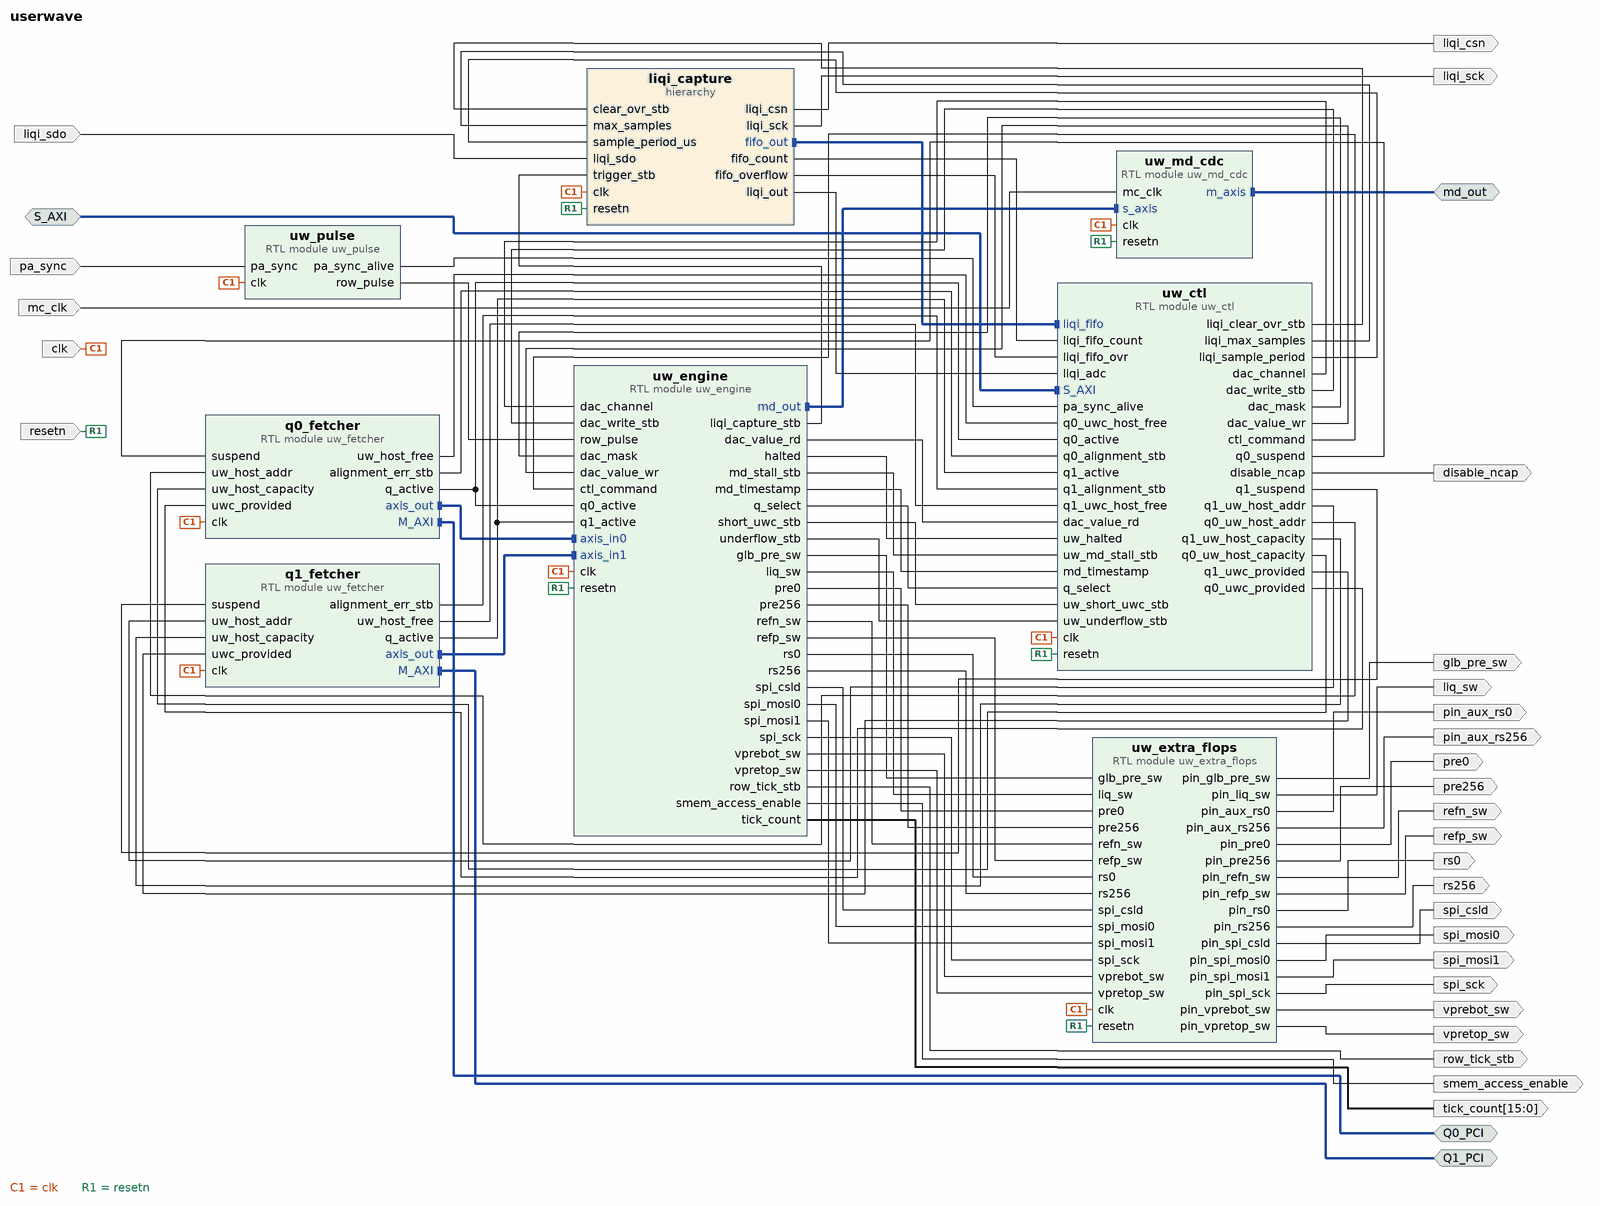
[diagram p0: block diagram of the top level]
# Vivado block design userwave, xcku15p-ffve1517-3-e, Vivado 2024.2
create_bd_design userwave

create_bd_intf_port -mode Master -vlnv xilinx.com:interface:aximm_rtl:1.0 Q0_PCI
set_property -dict [list \
  CONFIG.ADDR_WIDTH 64 \
  CONFIG.CLK_DOMAIN top_level_xdma_0_0_axi_aclk \
  CONFIG.DATA_WIDTH 512 \
  CONFIG.FREQ_HZ 250000000 \
  CONFIG.HAS_REGION 0 \
  CONFIG.NUM_READ_OUTSTANDING 2 \
  CONFIG.NUM_WRITE_OUTSTANDING 2 \
  CONFIG.PROTOCOL AXI4 \
] [get_bd_intf_ports Q0_PCI]
create_bd_intf_port -mode Master -vlnv xilinx.com:interface:aximm_rtl:1.0 Q1_PCI
set_property -dict [list \
  CONFIG.ADDR_WIDTH 64 \
  CONFIG.CLK_DOMAIN top_level_xdma_0_0_axi_aclk \
  CONFIG.DATA_WIDTH 512 \
  CONFIG.FREQ_HZ 250000000 \
  CONFIG.HAS_REGION 0 \
  CONFIG.NUM_READ_OUTSTANDING 2 \
  CONFIG.NUM_WRITE_OUTSTANDING 2 \
  CONFIG.PROTOCOL AXI4 \
] [get_bd_intf_ports Q1_PCI]
create_bd_intf_port -mode Slave -vlnv xilinx.com:interface:aximm_rtl:1.0 S_AXI
set_property -dict [list \
  CONFIG.ADDR_WIDTH 16 \
  CONFIG.ARUSER_WIDTH 0 \
  CONFIG.AWUSER_WIDTH 0 \
  CONFIG.BUSER_WIDTH 0 \
  CONFIG.CLK_DOMAIN top_level_xdma_0_0_axi_aclk \
  CONFIG.DATA_WIDTH 32 \
  CONFIG.FREQ_HZ 250000000 \
  CONFIG.HAS_BRESP 1 \
  CONFIG.HAS_BURST 0 \
  CONFIG.HAS_CACHE 0 \
  CONFIG.HAS_LOCK 0 \
  CONFIG.HAS_PROT 1 \
  CONFIG.HAS_QOS 0 \
  CONFIG.HAS_REGION 0 \
  CONFIG.HAS_RRESP 1 \
  CONFIG.HAS_WSTRB 1 \
  CONFIG.ID_WIDTH 0 \
  CONFIG.MAX_BURST_LENGTH 1 \
  CONFIG.NUM_READ_OUTSTANDING 1 \
  CONFIG.NUM_READ_THREADS 1 \
  CONFIG.NUM_WRITE_OUTSTANDING 1 \
  CONFIG.NUM_WRITE_THREADS 1 \
  CONFIG.PROTOCOL AXI4LITE \
  CONFIG.READ_WRITE_MODE READ_WRITE \
  CONFIG.RUSER_BITS_PER_BYTE 0 \
  CONFIG.RUSER_WIDTH 0 \
  CONFIG.SUPPORTS_NARROW_BURST 0 \
  CONFIG.WUSER_BITS_PER_BYTE 0 \
  CONFIG.WUSER_WIDTH 0 \
] [get_bd_intf_ports S_AXI]
create_bd_intf_port -mode Master -vlnv xilinx.com:interface:axis_rtl:1.0 md_out
set_property -dict {CONFIG.FREQ_HZ 250000000} [get_bd_intf_ports md_out]
create_bd_port -dir I -type clk clk
set_property -dict [list \
  CONFIG.ASSOCIATED_BUSIF S_AXI:Q1_PCI:Q0_PCI \
  CONFIG.CLK_DOMAIN top_level_xdma_0_0_axi_aclk \
  CONFIG.FREQ_HZ 250000000 \
] [get_bd_ports clk]
create_bd_port -dir O glb_pre_sw
create_bd_port -dir O liq_sw
create_bd_port -dir I pa_sync
create_bd_port -dir O pre0
create_bd_port -dir O pre256
create_bd_port -dir O refn_sw
create_bd_port -dir O refp_sw
create_bd_port -dir I -type rst resetn
create_bd_port -dir O row_tick_stb
create_bd_port -dir O rs0
create_bd_port -dir O rs256
create_bd_port -dir O smem_access_enable
create_bd_port -dir O spi_csld
create_bd_port -dir O spi_mosi0
create_bd_port -dir O spi_mosi1
create_bd_port -dir O spi_sck
create_bd_port -dir O -from 15 -to 0 tick_count
create_bd_port -dir O vprebot_sw
create_bd_port -dir O vpretop_sw
create_bd_port -dir O disable_ncap
create_bd_port -dir I -type clk mc_clk
set_property -dict {CONFIG.FREQ_HZ 250000000} [get_bd_ports mc_clk]
create_bd_port -dir O pin_aux_rs0
create_bd_port -dir O pin_aux_rs256
create_bd_port -dir O liqi_sck
create_bd_port -dir O liqi_csn
create_bd_port -dir I liqi_sdo

create_bd_cell -type module -reference uw_fetcher q0_fetcher
create_bd_cell -type module -reference uw_fetcher q1_fetcher
create_bd_cell -type module -reference uw_ctl uw_ctl
create_bd_cell -type module -reference uw_engine uw_engine
create_bd_cell -type module -reference uw_extra_flops uw_extra_flops
create_bd_cell -type module -reference uw_pulse uw_pulse
set_property -dict {CONFIG.PERIOD 256} [get_bd_cells uw_pulse]
create_bd_cell -type module -reference uw_md_cdc uw_md_cdc
create_bd_cell -type hier liqi_capture

# ---- hierarchy /liqi_capture ----
current_bd_instance /liqi_capture
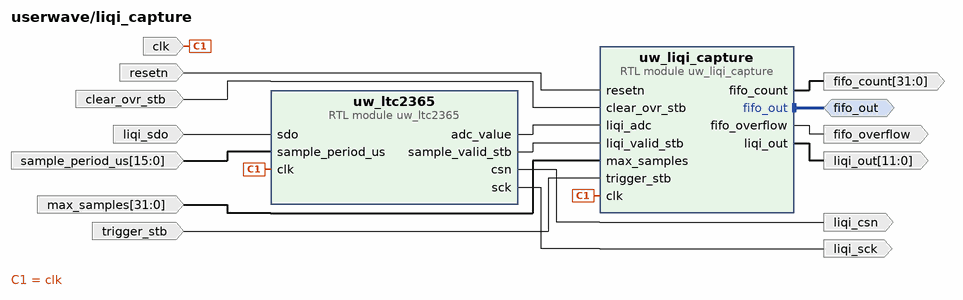
[diagram p1: block diagram inside /liqi_capture]
create_bd_intf_pin -mode Master -vlnv xilinx.com:interface:axis_rtl:1.0 fifo_out
create_bd_pin -dir I -type clk clk
create_bd_pin -dir I -type rst resetn
create_bd_pin -dir I trigger_stb
create_bd_pin -dir I -from 31 -to 0 max_samples
create_bd_pin -dir O -from 31 -to 0 fifo_count
create_bd_pin -dir O fifo_overflow
create_bd_pin -dir I clear_ovr_stb
create_bd_pin -dir O -from 11 -to 0 liqi_out
create_bd_pin -dir O liqi_sck
create_bd_pin -dir O liqi_csn
create_bd_pin -dir I liqi_sdo
create_bd_pin -dir I -from 15 -to 0 sample_period_us

create_bd_cell -type module -reference uw_liqi_capture uw_liqi_capture
create_bd_cell -type module -reference uw_ltc2365 uw_ltc2365

# ---- connections ----

current_bd_instance /liqi_capture
connect_bd_intf_net [get_bd_intf_pins fifo_out] [get_bd_intf_pins uw_liqi_capture/fifo_out]
connect_bd_net [get_bd_pins clk] [get_bd_pins uw_liqi_capture/clk] [get_bd_pins uw_ltc2365/clk]
connect_bd_net [get_bd_pins liqi_sdo] [get_bd_pins uw_ltc2365/sdo]
connect_bd_net [get_bd_pins resetn] [get_bd_pins uw_liqi_capture/resetn]
connect_bd_net -net uw_ctl_liqi_clear_ovr_stb [get_bd_pins clear_ovr_stb] [get_bd_pins uw_liqi_capture/clear_ovr_stb]
connect_bd_net -net uw_ctl_liqi_max_samples [get_bd_pins max_samples] [get_bd_pins uw_liqi_capture/max_samples]
connect_bd_net -net uw_ctl_liqi_sample_period [get_bd_pins sample_period_us] [get_bd_pins uw_ltc2365/sample_period_us]
connect_bd_net -net uw_engine_liqi_capture_stb [get_bd_pins trigger_stb] [get_bd_pins uw_liqi_capture/trigger_stb]
connect_bd_net [get_bd_pins uw_liqi_capture/fifo_count] [get_bd_pins fifo_count]
connect_bd_net [get_bd_pins uw_liqi_capture/fifo_overflow] [get_bd_pins fifo_overflow]
connect_bd_net [get_bd_pins uw_liqi_capture/liqi_out] [get_bd_pins liqi_out]
connect_bd_net [get_bd_pins uw_ltc2365/adc_value] [get_bd_pins uw_liqi_capture/liqi_adc]
connect_bd_net [get_bd_pins uw_ltc2365/csn] [get_bd_pins liqi_csn]
connect_bd_net [get_bd_pins uw_ltc2365/sample_valid_stb] [get_bd_pins uw_liqi_capture/liqi_valid_stb]
connect_bd_net [get_bd_pins uw_ltc2365/sck] [get_bd_pins liqi_sck]

current_bd_instance /
connect_bd_intf_net [get_bd_intf_ports S_AXI] [get_bd_intf_pins uw_ctl/S_AXI]
connect_bd_intf_net [get_bd_intf_pins uw_engine/md_out] [get_bd_intf_pins uw_md_cdc/s_axis]
connect_bd_intf_net -intf_net uw_fetcher_0_M_AXI [get_bd_intf_ports Q0_PCI] [get_bd_intf_pins q0_fetcher/M_AXI]
connect_bd_intf_net -intf_net uw_fetcher_1_M_AXI [get_bd_intf_ports Q1_PCI] [get_bd_intf_pins q1_fetcher/M_AXI]
connect_bd_intf_net -intf_net uw_fetcher_1_axis_out [get_bd_intf_pins q1_fetcher/axis_out] [get_bd_intf_pins uw_engine/axis_in1]
connect_bd_intf_net -intf_net uw_fetcher_axis_out [get_bd_intf_pins uw_engine/axis_in0] [get_bd_intf_pins q0_fetcher/axis_out]
connect_bd_intf_net -intf_net uw_liqi_capture_fifo_out [get_bd_intf_pins liqi_capture/fifo_out] [get_bd_intf_pins uw_ctl/liqi_fifo]
connect_bd_intf_net [get_bd_intf_pins uw_md_cdc/m_axis] [get_bd_intf_ports md_out]
connect_bd_net [get_bd_ports clk] \
  [get_bd_pins liqi_capture/clk] [get_bd_pins uw_ctl/clk] [get_bd_pins uw_extra_flops/clk] [get_bd_pins uw_pulse/clk] \
  [get_bd_pins q0_fetcher/clk] [get_bd_pins q1_fetcher/clk] [get_bd_pins uw_engine/clk] [get_bd_pins uw_md_cdc/clk]
connect_bd_net -net dac_channel_1 [get_bd_pins uw_ctl/dac_channel] [get_bd_pins uw_engine/dac_channel]
connect_bd_net -net dac_manual_start_stb_1 [get_bd_pins uw_ctl/dac_write_stb] [get_bd_pins uw_engine/dac_write_stb]
connect_bd_net -net dac_mask_1 [get_bd_pins uw_ctl/dac_mask] [get_bd_pins uw_engine/dac_mask]
connect_bd_net -net dac_value_wr_1 [get_bd_pins uw_ctl/dac_value_wr] [get_bd_pins uw_engine/dac_value_wr]
connect_bd_net [get_bd_ports liqi_sdo] [get_bd_pins liqi_capture/liqi_sdo]
connect_bd_net [get_bd_ports mc_clk] [get_bd_pins uw_md_cdc/mc_clk]
connect_bd_net [get_bd_ports pa_sync] [get_bd_pins uw_pulse/pa_sync]
connect_bd_net [get_bd_ports resetn] \
  [get_bd_pins liqi_capture/resetn] [get_bd_pins uw_ctl/resetn] [get_bd_pins uw_extra_flops/resetn] \
  [get_bd_pins uw_engine/resetn] [get_bd_pins uw_md_cdc/resetn]
connect_bd_net [get_bd_pins uw_ctl/ctl_command] [get_bd_pins uw_engine/ctl_command]
connect_bd_net [get_bd_pins uw_ctl/disable_ncap] [get_bd_ports disable_ncap]
connect_bd_net [get_bd_pins uw_ctl/liqi_clear_ovr_stb] [get_bd_pins liqi_capture/clear_ovr_stb]
connect_bd_net [get_bd_pins uw_ctl/liqi_max_samples] [get_bd_pins liqi_capture/max_samples]
connect_bd_net [get_bd_pins uw_ctl/liqi_sample_period] [get_bd_pins liqi_capture/sample_period_us]
connect_bd_net [get_bd_pins uw_ctl/q0_suspend] [get_bd_pins q0_fetcher/suspend]
connect_bd_net [get_bd_pins uw_ctl/q1_suspend] [get_bd_pins q1_fetcher/suspend]
connect_bd_net [get_bd_pins uw_ctl/q1_uw_host_addr] [get_bd_pins q1_fetcher/uw_host_addr]
connect_bd_net [get_bd_pins uw_ctl/q1_uw_host_capacity] [get_bd_pins q1_fetcher/uw_host_capacity]
connect_bd_net [get_bd_pins uw_ctl/q1_uwc_provided] [get_bd_pins q1_fetcher/uwc_provided]
connect_bd_net -net uw_ctl_uw_host_addr [get_bd_pins uw_ctl/q0_uw_host_addr] [get_bd_pins q0_fetcher/uw_host_addr]
connect_bd_net -net uw_ctl_uw_host_capacity [get_bd_pins uw_ctl/q0_uw_host_capacity] [get_bd_pins q0_fetcher/uw_host_capacity]
connect_bd_net -net uw_ctl_uwc_provided [get_bd_pins uw_ctl/q0_uwc_provided] [get_bd_pins q0_fetcher/uwc_provided]
connect_bd_net [get_bd_pins uw_engine/dac_value_rd] [get_bd_pins uw_ctl/dac_value_rd]
connect_bd_net [get_bd_pins uw_engine/glb_pre_sw] [get_bd_pins uw_extra_flops/glb_pre_sw]
connect_bd_net [get_bd_pins uw_engine/halted] [get_bd_pins uw_ctl/uw_halted]
connect_bd_net [get_bd_pins uw_engine/liq_sw] [get_bd_pins uw_extra_flops/liq_sw]
connect_bd_net [get_bd_pins uw_engine/liqi_capture_stb] [get_bd_pins liqi_capture/trigger_stb]
connect_bd_net [get_bd_pins uw_engine/md_stall_stb] [get_bd_pins uw_ctl/uw_md_stall_stb]
connect_bd_net [get_bd_pins uw_engine/md_timestamp] [get_bd_pins uw_ctl/md_timestamp]
connect_bd_net [get_bd_pins uw_engine/pre0] [get_bd_pins uw_extra_flops/pre0]
connect_bd_net [get_bd_pins uw_engine/pre256] [get_bd_pins uw_extra_flops/pre256]
connect_bd_net [get_bd_pins uw_engine/q_select] [get_bd_pins uw_ctl/q_select]
connect_bd_net [get_bd_pins uw_engine/refn_sw] [get_bd_pins uw_extra_flops/refn_sw]
connect_bd_net [get_bd_pins uw_engine/refp_sw] [get_bd_pins uw_extra_flops/refp_sw]
connect_bd_net [get_bd_pins uw_engine/row_tick_stb] [get_bd_ports row_tick_stb]
connect_bd_net [get_bd_pins uw_engine/rs0] [get_bd_pins uw_extra_flops/rs0]
connect_bd_net [get_bd_pins uw_engine/rs256] [get_bd_pins uw_extra_flops/rs256]
connect_bd_net [get_bd_pins uw_engine/short_uwc_stb] [get_bd_pins uw_ctl/uw_short_uwc_stb]
connect_bd_net [get_bd_pins uw_engine/smem_access_enable] [get_bd_ports smem_access_enable]
connect_bd_net [get_bd_pins uw_engine/spi_csld] [get_bd_pins uw_extra_flops/spi_csld]
connect_bd_net [get_bd_pins uw_engine/spi_mosi0] [get_bd_pins uw_extra_flops/spi_mosi0]
connect_bd_net [get_bd_pins uw_engine/spi_mosi1] [get_bd_pins uw_extra_flops/spi_mosi1]
connect_bd_net [get_bd_pins uw_engine/spi_sck] [get_bd_pins uw_extra_flops/spi_sck]
connect_bd_net [get_bd_pins uw_engine/tick_count] [get_bd_ports tick_count]
connect_bd_net [get_bd_pins uw_engine/underflow_stb] [get_bd_pins uw_ctl/uw_underflow_stb]
connect_bd_net [get_bd_pins uw_engine/vprebot_sw] [get_bd_pins uw_extra_flops/vprebot_sw]
connect_bd_net [get_bd_pins uw_engine/vpretop_sw] [get_bd_pins uw_extra_flops/vpretop_sw]
connect_bd_net -net uw_extra_flops_0_pin_glb_pre_sw [get_bd_pins uw_extra_flops/pin_glb_pre_sw] [get_bd_ports glb_pre_sw]
connect_bd_net -net uw_extra_flops_0_pin_liq_sw [get_bd_pins uw_extra_flops/pin_liq_sw] [get_bd_ports liq_sw]
connect_bd_net -net uw_extra_flops_0_pin_pre0 [get_bd_pins uw_extra_flops/pin_pre0] [get_bd_ports pre0]
connect_bd_net -net uw_extra_flops_0_pin_pre256 [get_bd_pins uw_extra_flops/pin_pre256] [get_bd_ports pre256]
connect_bd_net -net uw_extra_flops_0_pin_refn_sw [get_bd_pins uw_extra_flops/pin_refn_sw] [get_bd_ports refn_sw]
connect_bd_net -net uw_extra_flops_0_pin_refp_sw [get_bd_pins uw_extra_flops/pin_refp_sw] [get_bd_ports refp_sw]
connect_bd_net -net uw_extra_flops_0_pin_rs0 [get_bd_pins uw_extra_flops/pin_rs0] [get_bd_ports rs0]
connect_bd_net -net uw_extra_flops_0_pin_rs256 [get_bd_pins uw_extra_flops/pin_rs256] [get_bd_ports rs256]
connect_bd_net -net uw_extra_flops_0_pin_spi_csld [get_bd_pins uw_extra_flops/pin_spi_csld] [get_bd_ports spi_csld]
connect_bd_net -net uw_extra_flops_0_pin_spi_mosi0 [get_bd_pins uw_extra_flops/pin_spi_mosi0] [get_bd_ports spi_mosi0]
connect_bd_net -net uw_extra_flops_0_pin_spi_mosi1 [get_bd_pins uw_extra_flops/pin_spi_mosi1] [get_bd_ports spi_mosi1]
connect_bd_net -net uw_extra_flops_0_pin_spi_sck [get_bd_pins uw_extra_flops/pin_spi_sck] [get_bd_ports spi_sck]
connect_bd_net -net uw_extra_flops_0_pin_vprebot_sw [get_bd_pins uw_extra_flops/pin_vprebot_sw] [get_bd_ports vprebot_sw]
connect_bd_net -net uw_extra_flops_0_pin_vpretop_sw [get_bd_pins uw_extra_flops/pin_vpretop_sw] [get_bd_ports vpretop_sw]
connect_bd_net [get_bd_pins uw_extra_flops/pin_aux_rs0] [get_bd_ports pin_aux_rs0]
connect_bd_net [get_bd_pins uw_extra_flops/pin_aux_rs256] [get_bd_ports pin_aux_rs256]
connect_bd_net -net uw_fetcher_0_q_active [get_bd_pins q0_fetcher/q_active] [get_bd_pins uw_ctl/q0_active] [get_bd_pins uw_engine/q0_active]
connect_bd_net -net uw_fetcher_0_uw_host_free [get_bd_pins q0_fetcher/uw_host_free] [get_bd_pins uw_ctl/q0_uwc_host_free]
connect_bd_net -net uw_fetcher_1_alignment_err_stb [get_bd_pins q1_fetcher/alignment_err_stb] [get_bd_pins uw_ctl/q1_alignment_stb]
connect_bd_net -net uw_fetcher_1_q_active [get_bd_pins q1_fetcher/q_active] [get_bd_pins uw_ctl/q1_active] [get_bd_pins uw_engine/q1_active]
connect_bd_net -net uw_fetcher_1_uw_host_free [get_bd_pins q1_fetcher/uw_host_free] [get_bd_pins uw_ctl/q1_uwc_host_free]
connect_bd_net -net uw_fetcher_alignment_err_stb [get_bd_pins q0_fetcher/alignment_err_stb] [get_bd_pins uw_ctl/q0_alignment_stb]
connect_bd_net -net uw_liqi_capture_fifo_count [get_bd_pins liqi_capture/fifo_count] [get_bd_pins uw_ctl/liqi_fifo_count]
connect_bd_net -net uw_liqi_capture_fifo_overflow [get_bd_pins liqi_capture/fifo_overflow] [get_bd_pins uw_ctl/liqi_fifo_ovr]
connect_bd_net -net uw_liqi_capture_liqi_out [get_bd_pins liqi_capture/liqi_out] [get_bd_pins uw_ctl/liqi_adc]
connect_bd_net -net uw_ltc2365_csn [get_bd_pins liqi_capture/liqi_csn] [get_bd_ports liqi_csn]
connect_bd_net -net uw_ltc2365_sck [get_bd_pins liqi_capture/liqi_sck] [get_bd_ports liqi_sck]
connect_bd_net -net uw_pulse_pa_pulse [get_bd_pins uw_pulse/row_pulse] [get_bd_pins uw_engine/row_pulse]
connect_bd_net [get_bd_pins uw_pulse/pa_sync_alive] [get_bd_pins uw_ctl/pa_sync_alive]

# ---- address map ----
assign_bd_address -offset 0x0000000000000000 -range 16E -target_address_space [get_bd_addr_spaces q0_fetcher/M_AXI] [get_bd_addr_segs Q0_PCI/Reg]
assign_bd_address -offset 0x0000000000000000 -range 16E -target_address_space [get_bd_addr_spaces q1_fetcher/M_AXI] [get_bd_addr_segs Q1_PCI/Reg]
assign_bd_address -offset 0x1000 -range 4K -target_address_space [get_bd_addr_spaces S_AXI] [get_bd_addr_segs uw_ctl/S_AXI/reg0]

validate_bd_design
save_bd_design
